# Altium schematic sheet RSM.SchDoc
size A; SheetNumber: 1; SheetTotal: 4
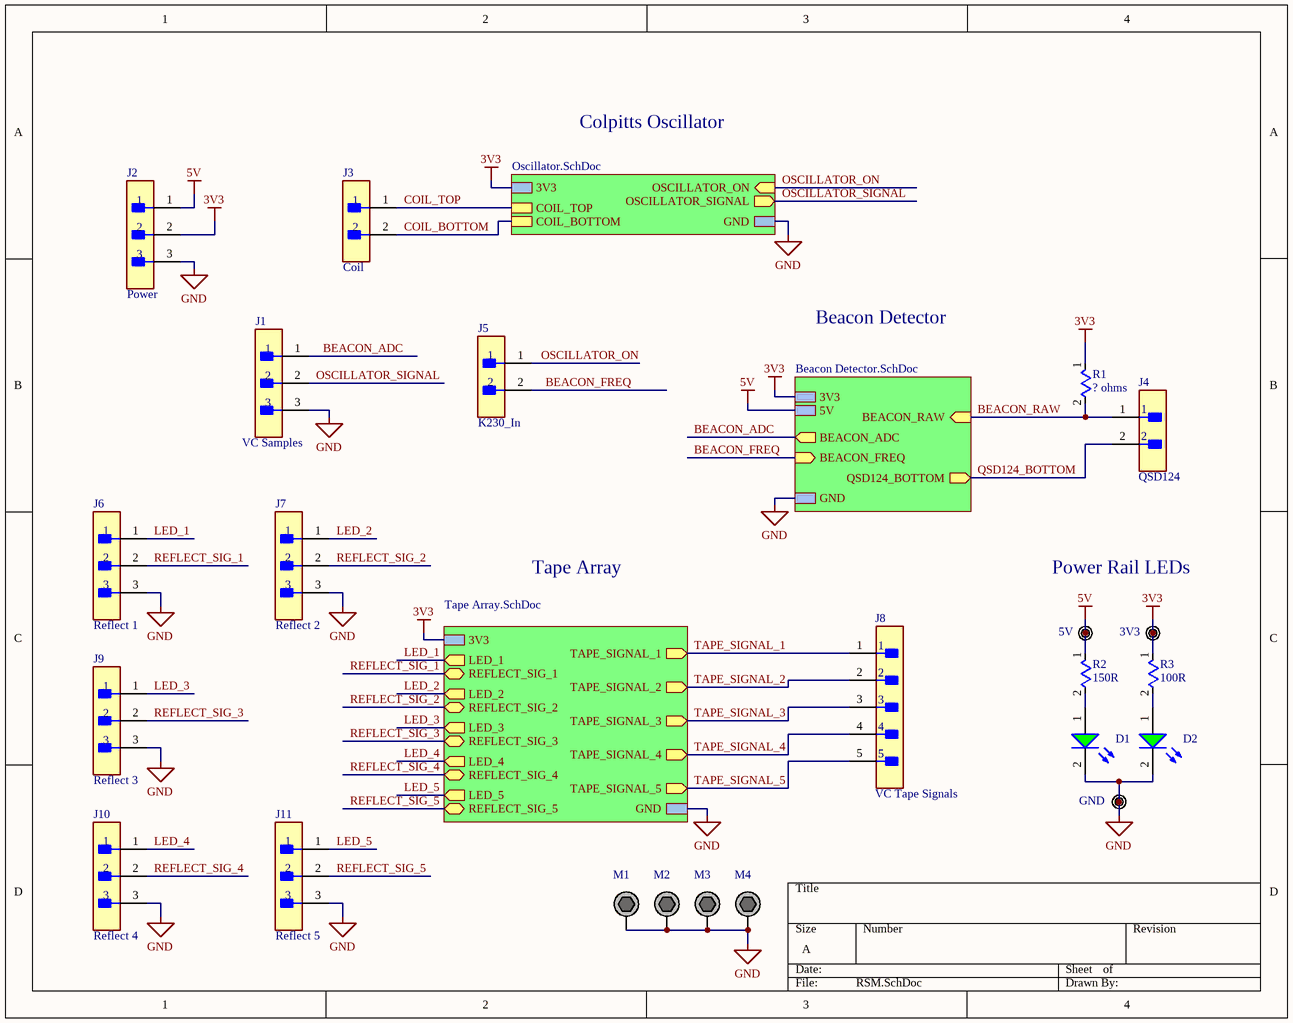
[diagram p0: RSM.SchDoc]

## Parts
D1  151051VS04000  [WL-TMRC_D5.9H8.7]  (value not drawn)
D2  151051VS04000  [WL-TMRC_D5.9H8.7]  (value not drawn)
J1  VC Samples  [FP-B3B-XH-A_LF_SN-MFG]
J2  Power  [FP-B3B-XH-A_LF_SN-MFG]
J3  Coil  [FP-B2B-XH-A_LF_SN-MFG]
J4  QSD124  [FP-B2B-XH-A_LF_SN-MFG]
J5  K230_In  [FP-B2B-XH-A_LF_SN-MFG]
J6  Reflect 1  [FP-B3B-XH-A_LF_SN-MFG]
J7  Reflect 2  [FP-B3B-XH-A_LF_SN-MFG]
J8  VC Tape Signals  [FP-B5B-XH-AM_LF_SN-MFG]
J9  Reflect 3  [FP-B3B-XH-A_LF_SN-MFG]
J10  Reflect 4  [FP-B3B-XH-A_LF_SN-MFG]
J11  Reflect 5  [FP-B3B-XH-A_LF_SN-MFG]
M1  M3 Mounting Hole Plated  [M3 Screw Hole - Plated]  (value not drawn)  (no BOM)
M2  M3 Mounting Hole Plated  [M3 Screw Hole - Plated]  (value not drawn)  (no BOM)
M3  M3 Mounting Hole Plated  [M3 Screw Hole - Plated]  (value not drawn)  (no BOM)
M4  M3 Mounting Hole Plated  [M3 Screw Hole - Plated]  (value not drawn)  (no BOM)
R1  ? ohms  [Axial 0.5]
R2  150R  [Axial 0.5]
R3  100R  [Axial 0.5]
TP1  5V  [TESTPOINT]  (no BOM)
TP2  3V3  [TESTPOINT]  (no BOM)
TP3  GND  [TESTPOINT]  (no BOM)

## Sub-sheets
Beacon Detector = Beacon Detector.SchDoc: 3V3, BEACON_RAW (in), GND, BEACON_ADC (out), BEACON_FREQ (in), QSD124_BOTTOM (out), 5V
Designator = Tape Array.SchDoc: LED_1 (out), REFLECT_SIG_1 (bidir), LED_2 (out), REFLECT_SIG_2 (bidir), LED_3 (out), REFLECT_SIG_3 (bidir), LED_4 (out), REFLECT_SIG_4 (bidir), REFLECT_SIG_5 (bidir), LED_5 (out), 3V3, GND, TAPE_SIGNAL_5 (out), TAPE_SIGNAL_4 (out), TAPE_SIGNAL_3 (out), TAPE_SIGNAL_2 (out), TAPE_SIGNAL_1 (out)
Designator = Oscillator.SchDoc: 3V3, COIL_TOP, COIL_BOTTOM, OSCILLATOR_ON (in), OSCILLATOR_SIGNAL (out), GND

## Nets
3V3: J2.2 R1.1 R3.1 TP2.1(TP) ; sheet Beacon Detector/3V3, sheet Designator/3V3, sheet Designator/3V3
5V: J2.1 R2.1 TP1.1(TP) ; sheet Beacon Detector/5V
GND: D1.2(K) D2.2(K) J1.3 J2.3 J6.3 J7.3 J9.3 J10.3 J11.3 M1.1 M2.1 M3.1 M4.1 TP3.1(TP) ; sheet Beacon Detector/GND, sheet Designator/GND, sheet Designator/GND
BEACON_ADC: J1.1 ; sheet Beacon Detector/BEACON_ADC
BEACON_FREQ: J5.2 ; sheet Beacon Detector/BEACON_FREQ
BEACON_RAW: J4.1 R1.2 ; sheet Beacon Detector/BEACON_RAW
COIL_BOTTOM: J3.2 ; sheet Designator/COIL_BOTTOM
COIL_TOP: J3.1 ; sheet Designator/COIL_TOP
LED_1: J6.1 ; sheet Designator/LED_1
LED_2: J7.1 ; sheet Designator/LED_2
LED_3: J9.1 ; sheet Designator/LED_3
LED_4: J10.1 ; sheet Designator/LED_4
LED_5: J11.1 ; sheet Designator/LED_5
OSCILLATOR_ON: J5.1 ; sheet Designator/OSCILLATOR_ON
OSCILLATOR_SIGNAL: J1.2 ; sheet Designator/OSCILLATOR_SIGNAL
QSD124_BOTTOM: J4.2 ; sheet Beacon Detector/QSD124_BOTTOM
REFLECT_SIG_1: J6.2 ; sheet Designator/REFLECT_SIG_1
REFLECT_SIG_2: J7.2 ; sheet Designator/REFLECT_SIG_2
REFLECT_SIG_3: J9.2 ; sheet Designator/REFLECT_SIG_3
REFLECT_SIG_4: J10.2 ; sheet Designator/REFLECT_SIG_4
REFLECT_SIG_5: J11.2 ; sheet Designator/REFLECT_SIG_5
TAPE_SIGNAL_1: J8.1 ; sheet Designator/TAPE_SIGNAL_1
TAPE_SIGNAL_2: J8.2 ; sheet Designator/TAPE_SIGNAL_2
TAPE_SIGNAL_3: J8.3 ; sheet Designator/TAPE_SIGNAL_3
TAPE_SIGNAL_4: J8.4 ; sheet Designator/TAPE_SIGNAL_4
TAPE_SIGNAL_5: J8.5 ; sheet Designator/TAPE_SIGNAL_5
NetD1_1: D1.1(A) R2.2
NetD2_1: D2.1(A) R3.2

## Notes on the sheet
- Colpitts Oscillator
- Beacon Detector
- Tape Array
- Power Rail LEDs

## Library data of the parts
D1 D2 = CMP-1488-00007-2: NexarPartId: 29717814; Forward Voltage: 2.1V; Viewing Angle: 40°; Lens Size: 5mm; Luminous Intensity: 140mcd; Color: Green; Max Reverse Voltage (DC): 5V; Wavelength: 572nm; Forward Current: 100mA; Peak Wavelength: 573nm; Test Current: 20mA; Lens Style: Circular, Diffused, Round; REACH SVHC: Unknown; Height: 8.6mm; Mount: Through Hole; Width: 5mm; Length: 5mm; Min Operating Temperature: -40°C; RoHS: Compliant; Dominant Wavelength: 572nm; Case/Package: Radial; Max Operating Temperature: 85°C; Packaging: Bulk
J1 J2 J6 J7 J9-J11 = CMP-17439-000014-3: CONN HEADER VERT 3POS 2.5MM; Max Voltage Rating (DC): 250V; Number of Positions: 3; Current Rating: 3A; Gender: Male; Wire/Cable Gauge: 22AWG; Contact Resistance: 20mR; Insulation Resistance: 1GR; Insulation Material: Nylon; Contact Plating: Tin; Depth: 5.75mm; Contact Type: Male Pin; Max Operating Temperature: 85°C; Insulation Color: Natural; Voltage Rating (AC): 250V; Color: Natural; Connector Type: Header; Orientation: Straight; Fastening Type: Detent; Housing Color: White; Min Operating Temperature: -25°C; Termination: Solder; Voltage Rating: 250V; Series: XH; Pitch: 2.5mm; Contact Shape: Square; Number of Rows: 1; Lead Free: Lead Free; Packaging: Bulk; Mount: Through Hole; Flammability Rating: UL94 V-0; Max Voltage Rating (AC): 250V; REACH SVHC: No SVHC; Housing Material: Polyamide; Contact Material: Brass; Lead Pitch: 2.5mm; Contact Finish - Mating: TIN; Length: 9.9mm; Max Current Rating: 3A; Number of Contacts: 3
J3-J5 = CMP-2000-05888-3: CONN HEADER VERT 2POS 2.5MM; Current Rating: 3A; Voltage Rating: 250V; Number of Contacts: 2; Contact Resistance: 20mR; Wire/Cable Gauge: 22AWG; Insulation Resistance: 1GR; Connector Type: Male Pin; Packaging: Bulk; Contact Material: Brass; Lead Free: Lead Free; Orientation: Straight; Contact Plating: Tin; Max Current Rating: 3A; Termination: Solder; Fastening Type: Detent; Depth: 5.75mm; Housing Material: Polyamide; REACH SVHC: No SVHC; Series: XH; Voltage Rating (AC): 250V; Number of Positions: 2; Color: Natural; Contact Type: Male Pin; Max Voltage Rating (DC): 250V; Pitch: 2.5mm; Lead Pitch: 2.5mm; Mount: Through Hole; Max Operating Temperature: 85°C; Length: 7.4mm; Max Voltage Rating (AC): 250V; Min Operating Temperature: -25°C; Number of Rows: 1; Housing Color: White
J8 = CMP-17439-000304-1: CONN HEADER VERT 5POS 2.5MM; Mated Stacking Heights: 9.8mm; Voltage Rating: 250V; Max Current Rating: 3A; Number of Positions: 5; Contact Resistance: 20mR; Depth: 5.75mm; Connector Type: Header; Color: Green; Insulation Material: Nylon; Contact Plating: Copper; Length: 14.9mm; Fastening Type: Detent; Contact Material: Brass; Number of Rows: 1; Contact Type: Male Pin; Housing Material: Polyamide; Housing Color: White; Lead Free: Lead Free; Max Voltage Rating (AC): 250V; Mount: Through Hole; Contact Shape: Square; Min Operating Temperature: -25°C; Packaging: Bulk; Orientation: Straight; Insulation Color: Natural; Series: XH; Flammability Rating: UL94 V-0; Contact Finish - Mating: TIN; Max Operating Temperature: 85°C; Termination: Solder; Pitch: 2.5mm
M1-M4 = CMP-019-000000-3: Design Item ID: M3 Mounting Hole Plated; Source: UBC Formula Electric.SchLib
R1-R3 = RES_GENERIC
TP1-TP3 = CMP-020-0000-4: Source: UBC Formula Electric.SchLib; Design Item ID: Thru-Hole Test Point